# Altium schematic sheet Top-Sheet.SchDoc
size A4; SheetNumber: 1; SheetTotal: 5
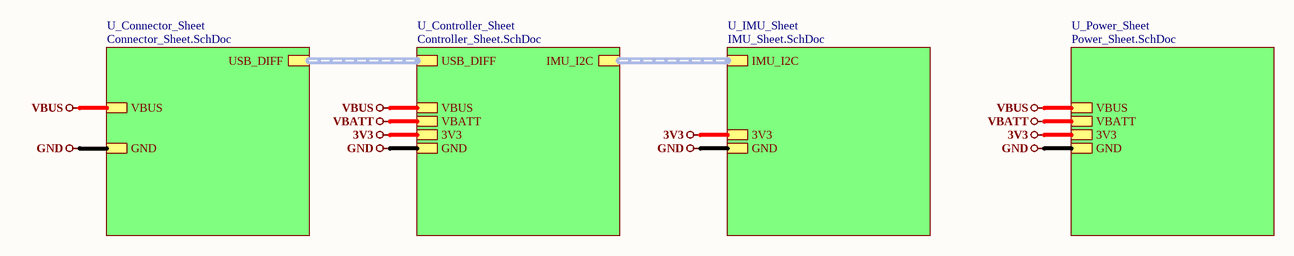
[diagram p0: Top-Sheet.SchDoc]

## Sub-sheets
U_Connector_Sheet = Connector_Sheet.SchDoc: USB_DIFF (harness USB_DIFF), VBUS, GND
U_Controller_Sheet = Controller_Sheet.SchDoc: USB_DIFF (harness USB_DIFF), IMU_I2C (harness IMU_I2C), VBUS, VBATT, 3V3, GND
U_IMU_Sheet = IMU_Sheet.SchDoc: IMU_I2C (harness IMU_I2C), 3V3, GND
U_Power_Sheet = Power_Sheet.SchDoc: VBUS, VBATT, 3V3, GND

## Nets
3V3: sheet U_Controller_Sheet/3V3, sheet U_IMU_Sheet/3V3, sheet U_Power_Sheet/3V3
GND: sheet U_Connector_Sheet/GND, sheet U_Controller_Sheet/GND, sheet U_IMU_Sheet/GND, sheet U_Power_Sheet/GND
VBATT: sheet U_Controller_Sheet/VBATT, sheet U_Power_Sheet/VBATT
VBUS: sheet U_Connector_Sheet/VBUS, sheet U_Controller_Sheet/VBUS, sheet U_Power_Sheet/VBUS

## Buses and harness runs
harness sheet U_Connector_Sheet/USB_DIFF = sheet U_Controller_Sheet/USB_DIFF
harness sheet U_Controller_Sheet/IMU_I2C = sheet U_IMU_Sheet/IMU_I2C

## Notes on the sheet
- File:
- Title:
- Date:
- Page
- Num:
- Total:
- Drawn By: Huzaifa Ali